# Altium schematic sheet MCU.SchDoc
size A3; ENG_APP_DATE: --/--/--; DSN_APP_DATE: --/--/--; CHK_APP_DATE: --/--/--; SheetNumber: 2; SheetTotal: 6
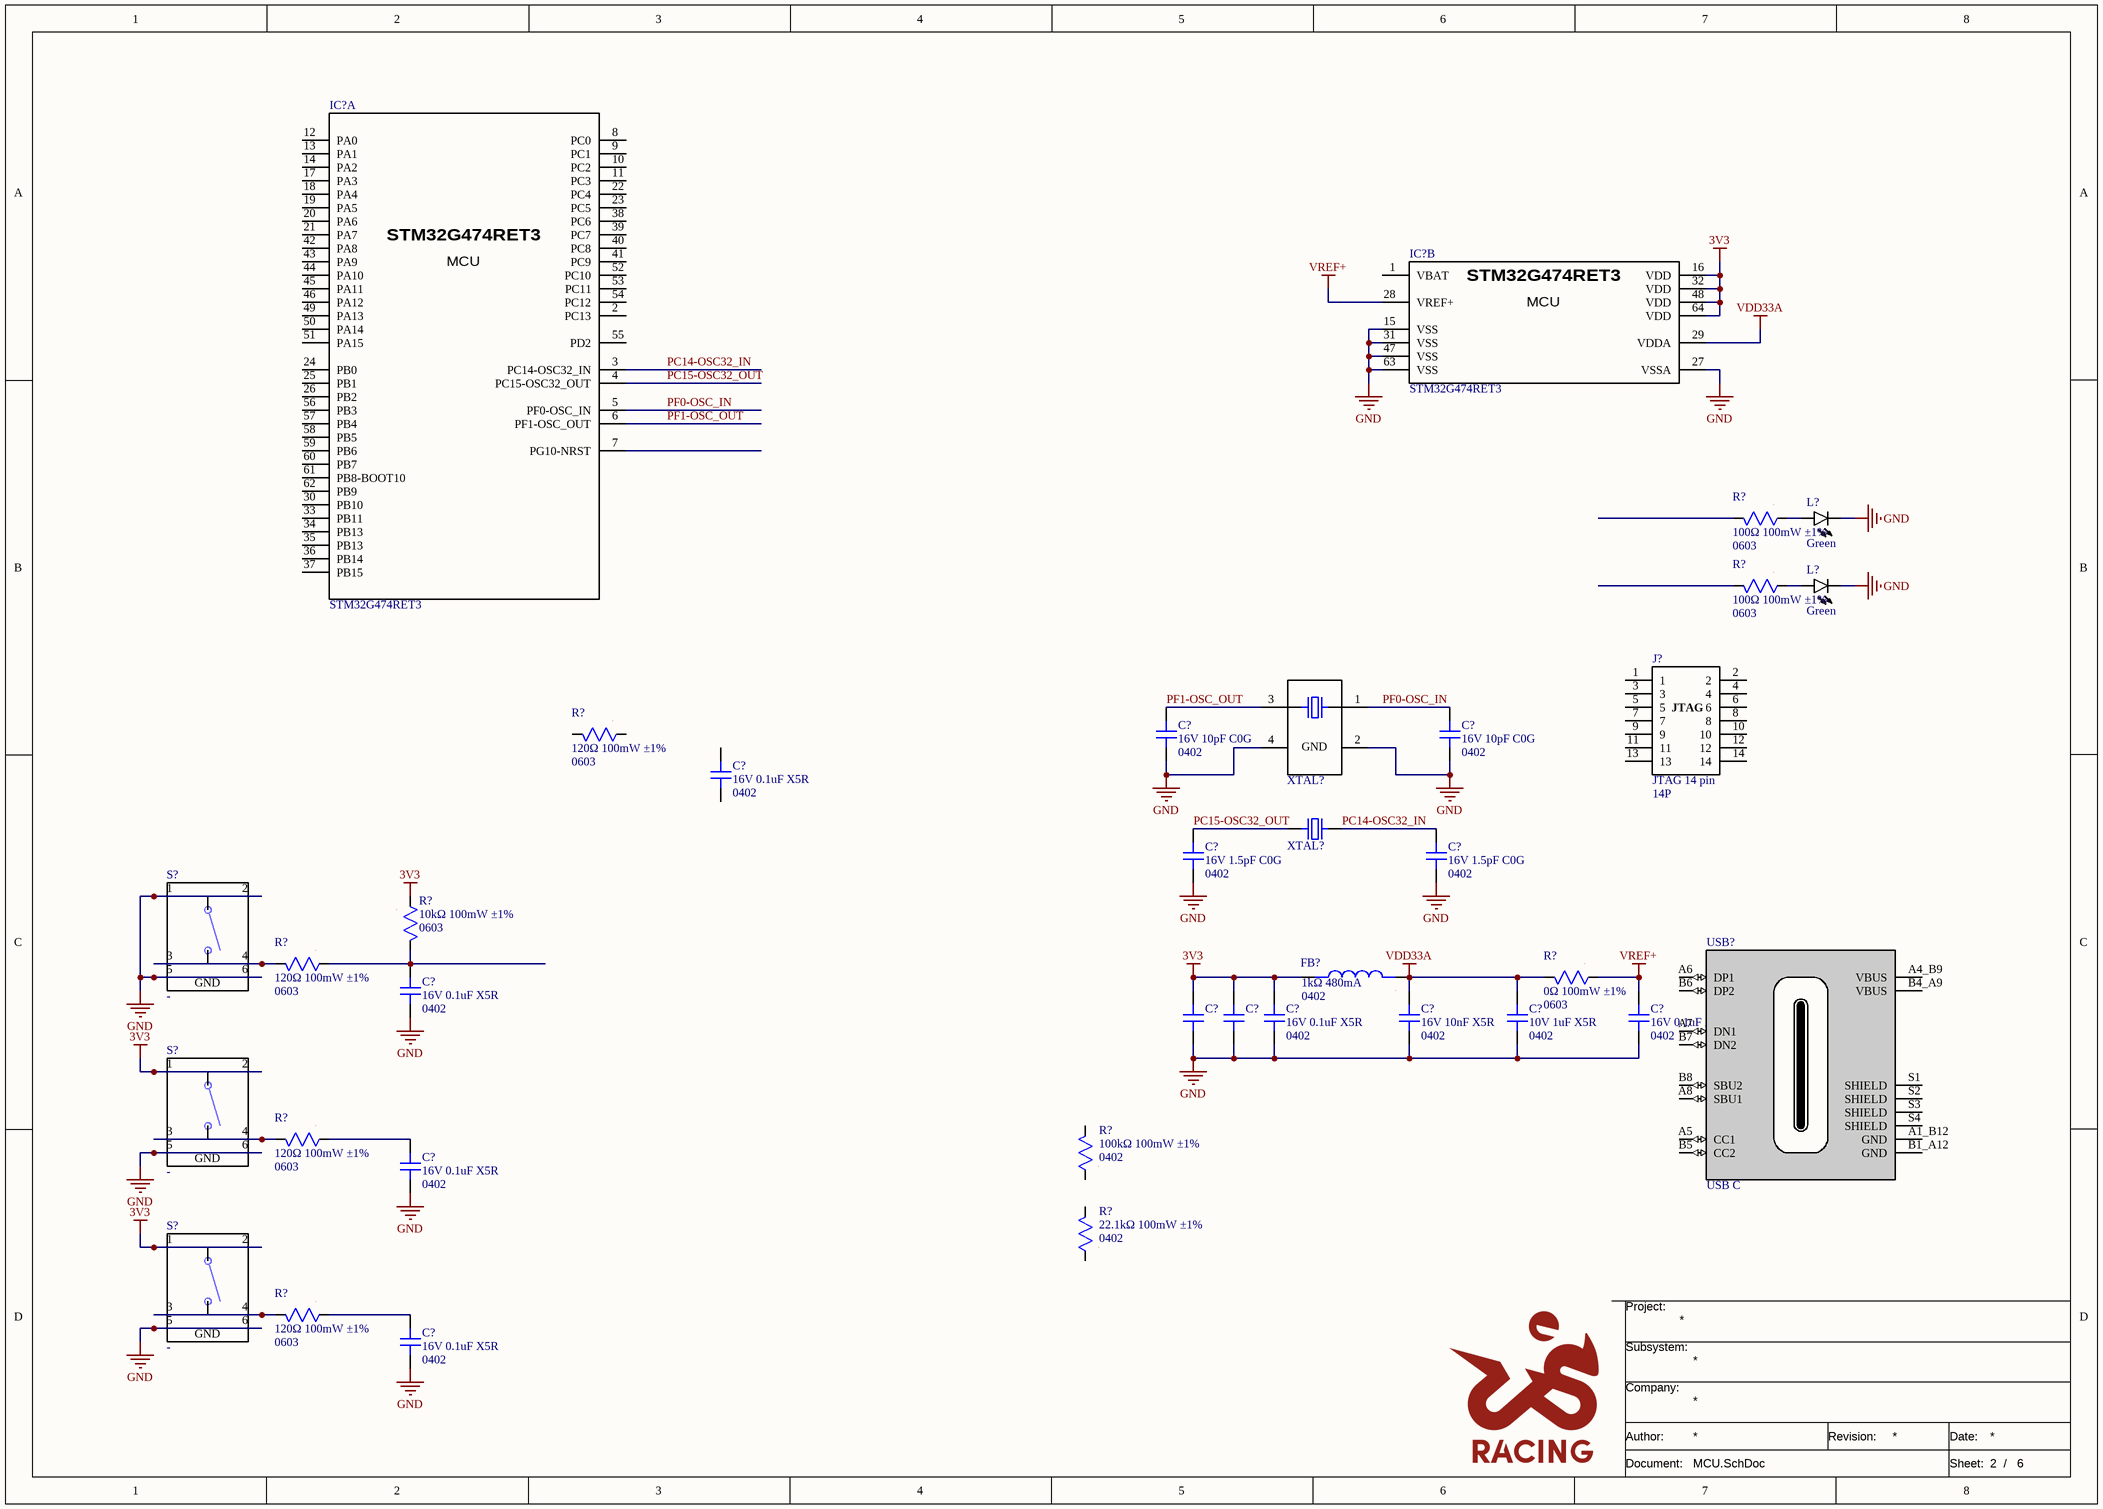
[diagram p0: MCU.SchDoc]

## Parts
(Parts that share a designator on the sheet are numbered #1, #2 ... from top to bottom, then left to right.)
C?#1  value 16V 10pF C0G  Package: 0402  [CAP SMD 0402]  (hidden comment: CAP non polarized)
C?#2  value 16V 10pF C0G  Package: 0402  [CAP SMD 0402]  (hidden comment: CAP non polarized)
C?#3  value 16V 0.1uF X5R  Package: 0402  [CAP SMD 0402]  (hidden comment: CAP non polarized)
C?#4  value 16V 1.5pF C0G  Package: 0402  [CAP SMD 0402]  (hidden comment: CAP non polarized)
C?#5  value 16V 1.5pF C0G  Package: 0402  [CAP SMD 0402]  (hidden comment: CAP non polarized)
C?#6  value 16V 0.1uF X5R  Package: 0402  [CAP SMD 0402]  (hidden comment: CAP non polarized)
C?#7  CAP non polarized  [CAP SMD 0402]  (value not drawn)
C?#8  CAP non polarized  [CAP SMD 0402]  (value not drawn)
C?#9  value 16V 0.1uF X5R  Package: 0402  [CAP SMD 0402]  (hidden comment: CAP non polarized)
C?#10  value 16V 10nF X5R  Package: 0402  [CAP SMD 0402]  (hidden comment: CAP non polarized)
C?#11  value 10V 1uF X5R  Package: 0402  [CAP SMD 0402]  (hidden comment: CAP non polarized)
C?#12  value 16V 0.1uF X5R  Package: 0402  [CAP SMD 0402]  (hidden comment: CAP non polarized)
C?#13  value 16V 0.1uF X5R  Package: 0402  [CAP SMD 0402]  (hidden comment: CAP non polarized)
C?#14  value 16V 0.1uF X5R  Package: 0402  [CAP SMD 0402]  (hidden comment: CAP non polarized)
FB?  value 1kΩ 480mA  Package: 0402  [IND 0402]  (hidden comment: IND_FB)
IC?#1  STM32G474RET3  [LQFP-64]  (part B of 2)
IC?#2  STM32G474RET3  [LQFP-64]  (part A of 2)
J?  JTAG 14 pin  value 14P  [62131421021]
L?#1  value Green  [LED SMD 0603]  (hidden comment: LED WHITE)
L?#2  value Green  [LED SMD 0603]  (hidden comment: LED WHITE)
R?#1  value 100Ω 100mW ±1%  Package: 0603  [RES SMD 0603]  (hidden comment: RES)
R?#2  value 100Ω 100mW ±1%  Package: 0603  [RES SMD 0603]  (hidden comment: RES)
R?#3  value 120Ω 100mW ±1%  Package: 0603  [RES SMD 0603]  (hidden comment: RES)
R?#4  value 10kΩ 100mW ±1%  Package: 0603  [RES SMD 0603]  (hidden comment: RES)
R?#5  value 120Ω 100mW ±1%  Package: 0603  [RES SMD 0603]  (hidden comment: RES)
R?#6  value 0Ω 100mW ±1%  Package: 0603  [RES SMD 0603]  (hidden comment: RES)
R?#7  value 120Ω 100mW ±1%  Package: 0603  [RES SMD 0603]  (hidden comment: RES)
R?#8  value 100kΩ 100mW ±1%  Package: 0402  [RES SMD 0402]  (hidden comment: RES)
R?#9  value 22.1kΩ 100mW ±1%  Package: 0402  [RES SMD 0402]  (hidden comment: RES)
R?#10  value 120Ω 100mW ±1%  Package: 0603  [RES SMD 0603]  (hidden comment: RES)
S?#1  SWITCH_6pines  [435171014816]  (value not drawn)
S?#2  SWITCH_6pines  [435171014816]  (value not drawn)
S?#3  SWITCH_6pines  [435171014816]  (value not drawn)
USB?  value USB C  [TYPE-C-31-M-12]  (hidden comment: TYPE-C-31-M-12)
XTAL?#1  XTAL-4  [SMD3225-4P]  (value not drawn)
XTAL?#2  XTAL  [SMD3215-2P]  (value not drawn)

## Nets
3V3: C?#7.1 C?#8.1 C?#9.1 FB?.1 IC?#1.16(VDD) IC?#1.32(VDD) IC?#1.48(VDD) IC?#1.64(VDD) R?#4.1 S?#2.1 S?#2.2 S?#3.1 S?#3.2
GND: C?#1.2 C?#2.2 C?#4.2 C?#5.2 C?#6.2 C?#7.2 C?#8.2 C?#9.2 C?#10.2 C?#11.2 C?#12.2 C?#13.2 C?#14.2 IC?#1.15(VSS) IC?#1.27(VSSA) IC?#1.31(VSS) IC?#1.47(VSS) IC?#1.63(VSS) L?#1.C L?#2.C S?#1.1 S?#1.2 S?#1.5 S?#1.6 S?#2.5 S?#2.6 S?#3.5 S?#3.6 XTAL?#1.2(GND_1) XTAL?#1.4(GND_2)
VDD33A: C?#10.1 C?#11.1 FB?.2 IC?#1.29(VDDA) R?#6.2
VREF+: C?#12.1 IC?#1.28(VREF+) R?#6.1
PC14-OSC32_IN: C?#5.1 IC?#2.3(PC14-OSC32_IN) XTAL?#2.2
PC15-OSC32_OUT: C?#4.1 IC?#2.4(PC15-OSC32_OUT) XTAL?#2.1
PF0-OSC_IN: C?#2.1 IC?#2.5(PF0-OSC_IN) XTAL?#1.1(CRYSTAL_1)
PF1-OSC_OUT: C?#1.1 IC?#2.6(PF1-OSC_OUT) XTAL?#1.3(CRYSTAL_2)
NetC?#6_1: C?#6.1 R?#4.2 R?#5.1
NetC?#13_1: C?#13.1 R?#7.1
NetC?#14_1: C?#14.1 R?#10.1
NetL?#1_A: L?#1.A R?#1.1
NetL?#2_A: L?#2.A R?#2.1
NetR?#5_2: R?#5.2 S?#1.3 S?#1.4
NetR?#7_2: R?#7.2 S?#2.3 S?#2.4
NetR?#10_2: R?#10.2 S?#3.3 S?#3.4

Not connected (* = marked no-connect by the designer): C?#3 1 2; IC?#1 1(VBAT); IC?#2 2(PC13) 7(PG10-NRST) 8(PC0) 9(PC1) 10(PC2) 11(PC3) 12(PA0) 13(PA1) 14(PA2) 17(PA3) 18(PA4) 19(PA5) 20(PA6) 21(PA7) 22(PC4) 23(PC5) 24(PB0) 25(PB1) 26(PB2) 30(PB10) 33(PB11) 34(PB13) 35(PB13) 36(PB14) 37(PB15) 38(PC6) 39(PC7) 40(PC8) 41(PC9) 42(PA8) 43(PA9) 44(PA10) 45(PA11) 46(PA12) 49(PA13) 50(PA14) 51(PA15) 52(PC10) 53(PC11) 54(PC12) 55(PD2) 56(PB3) 57(PB4) 58(PB5) 59(PB6) 60(PB7) 61(PB8-BOOT10) 62(PB9); J? 1 2 3 4 5 6 7 8 9 10 11 12 13 14; R?#1 2; R?#2 2; R?#3 1 2; R?#8 1 2; R?#9 1 2; USB? A1_B12(GND) A4_B9(VBUS) A5(CC1) A6(DP1) A7(DN1) A8(SBU1) B1_A12(GND) B4_A9(VBUS) B5(CC2) B6(DP2) B7(DN2) B8(SBU2) S1(SHIELD) S2(SHIELD) S3(SHIELD) S4(SHIELD)

## Notes on the sheet
- Project:
- Subsystem:
- Company:
- Document:
- Author:
- Revision:
- Date:
- Sheet:
- /
- (in symbol 045-0002) GND
- (in symbol 090-0003, part A) MCU
- (in symbol 090-0003, part B) MCU
- (in symbol 100-0027) GND
- (in symbol 110-0073) JTAG

## Library data of the parts
C?#1 C?#2 = 001-0098: Condensadores de cerámica multicapa (MLCC- SMD/SMT) WCAP-CSGP 10pF 0402 5% 16V MLCC; MPN: 885012005025; Manufacturer: Wurth Elektronik; ComponentLink1Description: Datasheet; ComponentLink1URL: https://www.we-online.com/components/products/datasheet/885012005025.pdf; ComponentLink2Description: Distributor Link; ComponentLink2URL: https://www.mouser.es/ProductDetail/Wurth-Elektronik/885012005025?qs=0KOYDY2FL2%2F1u5tcR38OjQ%3D%3D; ID: 001-0098; Distributor PN: 710-885012005025; Distributor: Mouser
C?#3 C?#6 C?#9 C?#12-C?#14 = 001-0099: Condensadores de cerámica multicapa (MLCC- SMD/SMT) WCAP-CSGP 0.1uF 0402 20% 16V MLCC; MPN: 885012105016; Manufacturer: Wurth Elektronik; ComponentLink1Description: Datasheet; ComponentLink1URL: https://www.we-online.com/components/products/datasheet/885012105016.pdf; ComponentLink2Description: Distributor Link; ComponentLink2URL: https://www.mouser.es/ProductDetail/Wurth-Elektronik/885012105016?qs=0KOYDY2FL2%2FPbpf70bBQeA%3D%3D; ID: 001-0099; Distributor PN: 710-885012105016; Distributor: Mouser
C?#4 C?#5 = 001-0097: Condensadores de cerámica multicapa (MLCC- SMD/SMT) WCAP-CSGP 1.5pF 0402 0.5pF TOL 16V; MPN: 885012005020; Manufacturer: Wurth Elektronik; ComponentLink1Description: Datasheet; ComponentLink1URL: https://www.we-online.com/components/products/datasheet/885012005020.pdf; ComponentLink2Description: Distributor Link; ComponentLink2URL: https://www.mouser.es/ProductDetail/Wurth-Elektronik/885012005020?qs=0KOYDY2FL2%2FpnGt3CBSzcg%3D%3D; ID: 001-0097; Distributor PN: 710-885012005020; Distributor: Mouser
C?#7 C?#8 = 001-0099: Condensadores de cerámica multicapa (MLCC- SMD/SMT) WCAP-CSGP 0.1uF 0402 20% 16V MLCC; MPN: 885012105016; Manufacturer: Wurth Elektronik; Value: 16V 0.1uF X5R; ComponentLink1Description: Datasheet; ComponentLink1URL: https://www.we-online.com/components/products/datasheet/885012105016.pdf; ComponentLink2Description: Distributor Link; ComponentLink2URL: https://www.mouser.es/ProductDetail/Wurth-Elektronik/885012105016?qs=0KOYDY2FL2%2FPbpf70bBQeA%3D%3D; Package: 0402; ID: 001-0099; Distributor PN: 710-885012105016; Distributor: Mouser
C?#10 = 001-0101: Condensadores de cerámica multicapa (MLCC- SMD/SMT) WCAP-CSGP 0.01uF 0402 10% 16V MLCC; MPN: 885012205031; Manufacturer: Wurth Elektronik; ComponentLink1Description: Datasheet; ComponentLink1URL: https://www.we-online.com/components/products/datasheet/885012205031.pdf; ComponentLink2Description: Distributor Link; ComponentLink2URL: https://www.mouser.es/ProductDetail/Wurth-Elektronik/885012205031?qs=0KOYDY2FL28GOkIyNosgaQ%3D%3D; ID: 001-0101; Distributor PN: 710-885012205031; Distributor: Mouser
C?#11 = 001-0103: Condensadores de cerámica multicapa (MLCC- SMD/SMT) WCAP-CSGP 1uF 0402 20% 10V MLCC; MPN: 885012105012; Manufacturer: Wurth Elektronik; ComponentLink1Description: Datasheet; ComponentLink1URL: https://www.we-online.com/components/products/datasheet/885012105012.pdf; ComponentLink2Description: Distributor Link; ComponentLink2URL: https://www.mouser.es/ProductDetail/Wurth-Elektronik/885012105012?qs=0KOYDY2FL28qr2YJ9j3qRw%3D%3D; ID: 001-0103; Distributor PN: 710-885012105012; Distributor: Mouser
FB? = 025-0000: Ferrite Beads WE-TMSB 1KOhms 480mA 0402 0.48OhmsFerrite Beads WE-TMSB 1KOhms 480mA 0402 0.48Ohms; MPN: 74269241102; Manufacturer: Wurth Elektronik; ComponentLink1Description: Datasheet; ComponentLink1URL: https://www.we-online.com/components/products/datasheet/74269241102.pdf; ComponentLink2Description: Distributor Link; ComponentLink2URL: https://www.mouser.es/en/ProductDetail/Wurth-Elektronik/74269241102?qs=sGAEpiMZZMt1hubY80%2Fs8KH3ycnB7WcGH5zBhJgtJewoq2%2Fz%252B%252BrYnA%3D%3D; ID: 025-0000; Distributor PN: 710-74269241102; Distributor: Mouser
IC?#1 IC?#2 = 090-0003: Manufacturer: STMicroelectronics; Part: A; Value: 64; ComponentLink1Description: Datasheet; ComponentLink1URL: https://www.st.com/resource/en/datasheet/stm32g474cb.pdf; ComponentLink2Description: Distributor Link; ComponentLink2URL: https://eu.mouser.com/es/ProductDetail/STMicroelectronics/STM32G474RET3?qs=xZ%2FP%252Ba9zWqYL6K%252Ba4ZBwGg%3D%3D&utm_id=23821683267&utm_source=google&utm_medium=cpc&utm_marketing_tactic=emeacorp&gad_source=1&gad_campaignid=23831526469&gclid=CjwKCAjwo5bXBhAEEiwAkgpgXFoVNMCcMIasSOy0ajQZ565iz1k746ihTKoKU2Qb_o3jNNa2YsoRDhoC5o0QAvD_BwE; ID: 090-0003; Package: LQFP-64; MPN: STM32G474RET3; Distributor PN: 511-STM32G474RET3; Distributor: Mouser
J? = 110-0073: Headers & Wire Housings WR-PHD 1.27mm SMT St SMT 14P 2Row H=3.8m; Manufacturer: Wurth Elektronik; ComponentLink1Description: Datasheet; ComponentLink1URL: https://www.we-online.com/components/products/datasheet/62131421021.pdf; ComponentLink2Description: Distributor Link; ComponentLink2URL: https://www.mouser.es/en/ProductDetail/Wurth-Elektronik/62131421021?qs=7D1LtPJG0i0y%252BqER0PgICg%3D%3D; ID: 110-0073; Package: SMD 1,27mm; MPN: 62131421021; Distributor PN: 710-62131421021; Distributor: Mouser
L?#1 L?#2 = 033-0023: LED de un solo color Green 525nm 1400mcd 2.85V 73deg 0603; MPN: VLMTG1400-GS08; Manufacturer: Vishay Semiconductors; ComponentLink1Description: Datasheet; ComponentLink1URL: https://www.vishay.com/docs/84393/vlmtg1400.pdf; ComponentLink2Description: Distributor Link; ComponentLink2URL: https://www.mouser.es/ProductDetail/Vishay-Semiconductors/VLMTG1400-GS08?qs=gt1LBUVyoHlZ6yHd8iEIzQ%3D%3D; ID: 033-0023; Package: 0603; Distributor PN: 78-VLMTG1400-GS08; Distributor: Mouser
R?#1 R?#2 = 010-0172: Thick Film Resistors WRIS-RSKS 100 Ohms 1 % 0.1 W 0603 AEC-Q200; MPN: 560112116009; Manufacturer: Wurth Elektronik; ComponentLink1Description: Datasheet; ComponentLink1URL: https://www.we-online.com/components/products/datasheet/560112116009.pdf; ComponentLink2Description: Distributor Link; ComponentLink2URL: https://www.mouser.es/ProductDetail/Wurth-Elektronik/560112116009?qs=sGAEpiMZZMvdGkrng054txLI%2FDB4oIKDTCqaE%2Fpesdwv2JWXHdCmlQ%3D%3D; ID: 010-0172; Distributor PN: 710-560112116009; Distributor: Mouser
R?#3 R?#5 R?#7 R?#10 = 010-0177: Resistores de película gruesa - SMD WRIS-RSKS 120 Ohms 1 % 0.1 W 0603 AEC-Q200; MPN: 560112116119; Manufacturer: Wurth Elektronik; ComponentLink1Description: Datasheet; ComponentLink1URL: https://www.we-online.com/components/products/datasheet/560112116119.pdf; ComponentLink2Description: Distributor Link; ComponentLink2URL: https://www.mouser.es/ProductDetail/Wurth-Elektronik/560112116119?qs=mELouGlnn3eT%2F22oIMY8Ng%3D%3D; ID: 010-0177; Distributor PN: 710-560112116119; Distributor: Mouser
R?#4 = 010-0145: Resistores de película gruesa - SMD WRIS-RSKS 10 kOhms 1 % 0.1 W 0603 AEC-Q200; MPN: 560112116005; Manufacturer: Wurth Elektronik; ComponentLink1Description: Datasheet; ComponentLink1URL: https://www.we-online.com/components/products/datasheet/560112116005.pdf; ComponentLink2Description: Distributor Link; ComponentLink2URL: https://www.mouser.es/ProductDetail/Wurth-Elektronik/560112116005?qs=mELouGlnn3dMVSPHwBGouA%3D%3D; ID: 010-0145; Distributor PN: 710-560112116005; Distributor: Mouser
R?#6 = 010-0160: Resistores de película gruesa - SMD WRIS-RSKS <0.05 Ohms 0.1 W Jumper 0603 AEC-Q200; MPN: 560112116001; Manufacturer: Wurth Elektronik; ComponentLink1Description: Datasheet; ComponentLink1URL: https://www.we-online.com/components/products/datasheet/560112116001.pdf; ComponentLink2Description: Distributor Link; ComponentLink2URL: https://www.mouser.es/ProductDetail/Wurth-Elektronik/560112116001?qs=mELouGlnn3dlnHYj7TecuA%3D%3D; ID: 010-0160; Distributor PN: 710-560112116001; Distributor: Mouser
R?#8 = 010-0159: Resistores de película gruesa - SMD WRIS-RSKS 100 kOhms 1 % 0.1 W 0402 AEC-Q200; MPN: 560112110019; Manufacturer: Wurth Elektronik; ComponentLink1Description: Datasheet; ComponentLink1URL: https://www.we-online.com/components/products/datasheet/560112110019.pdf; ComponentLink2Description: Distributor Link; ComponentLink2URL: https://www.mouser.es/ProductDetail/Wurth-Elektronik/560112110019?qs=mELouGlnn3eOtqJeFyZVpA%3D%3D; ID: 010-0159; Distributor PN: 710-560112110019; Distributor: Mouser
R?#9 = 010-0157: Resistores de película gruesa - SMD WRIS-RSKS 22.1 kOhms 1 % 0.1 W 0402 AEC-Q200; MPN: 560112110099; Manufacturer: Wurth Elektronik; ComponentLink1Description: Datasheet; ComponentLink1URL: https://www.we-online.com/components/products/datasheet/560112110099.pdf; ComponentLink2Description: Distributor Link; ComponentLink2URL: https://www.mouser.es/ProductDetail/Wurth-Elektronik/560112110099?qs=mELouGlnn3eF8MLEVMJrCw%3D%3D; ID: 010-0157; Distributor PN: 710-560112110099; Distributor: Mouser
S?#1-S?#3 = 100-0027: Interruptores táctiles WS-TASV Tact Switch; Manufacturer: Würth Elektronik; ComponentLink1Description: Datasheet; ComponentLink1URL: https://www.we-online.com/components/products/datasheet/435171014816.pdf; ComponentLink2Description: Distributor Link; ComponentLink2URL: https://www.mouser.es/es/ProductDetail/Wurth-Elektronik/435171014816?qs=OlC7AqGiEDk48AGNB0DYWA%3D%3D; ID: 100-0027; Value: -; Package: SMD,3.5x2.6mm; MPN: 435171014816; Distributor PN: 710-435171014816; Distributor: Mouser
USB? = 110-0074: Conectores USB WR-COM Receptacle USB 2.0 Type C Horizontal SMT 16 pins- PCB Thickness 0.8mm; MPN: 6,2972200021e+11; Manufacturer: Wurth Elektronik; ComponentLink1Description: Datasheet; ComponentLink1URL: https://www.we-online.com/components/products/datasheet/629722000214.pdf; ComponentLink2Description: Distributor Link; ComponentLink2URL: https://eu.mouser.com/es/ProductDetail/Wurth-Elektronik/629722000214?qs=1Kr7Jg1SGW93XYhc8K3hvA%3D%3D; ID: 110-0074; Package: USB C; Distributor PN: 710-629722000214; Distributor: Mouser
XTAL?#1 = 045-0002: Cristales CRYSTAL 8.0000MHZ 10PF SMD,ECX-32,10ppm,25ppm,400 Ohm,Fundamental,-40C - 85C,4-SMD, No Lead (DFN, LCC),0.126" L x 0.098" W (3.20mm x 2.50mm),0.031" (0.80mm); MPN: ECS-80-10-33-CHN-TR; Manufacturer: ECS; Value: 8M; ComponentLink1Description: Datasheet; ComponentLink1URL: https://www.ecsxtal.com/store/pdf/ecx-32.pdf; ComponentLink2Description: Distributor Link; ComponentLink2URL: https://www.mouser.es/ProductDetail/ECS/ECS-80-10-33-CHN-TR?qs=W%2FMpXkg%252BdQ6xEmLXccABKw%3D%3D; ID: 045-0002; Package: SMD3225; Distributor PN: 520-ECS-80-1033CHNTR; Distributor: Mouser
XTAL?#2 = 045-0001: Cristales CRYSTAL 32.768KHZ 12.5PF SMD; MPN: STDMUA8-32.768K; Manufacturer: NDK; ComponentLink1Description: Datasheet; ComponentLink1URL: https://www.mouser.es/datasheet/3/1591/1/c_NX3215SA_e.pdf; ComponentLink2Description: Distributor Link; ComponentLink2URL: https://www.mouser.es/ProductDetail/NDK/STDMUA8-32.768K?qs=Tc%252BHE9vUsnvUQACJk1V1jw%3D%3D; ID: 045-0001; Value: 32.768K; Package: SMD3215-2P; Distributor PN: 344-NX3215SA32768K8; Distributor: Mouser